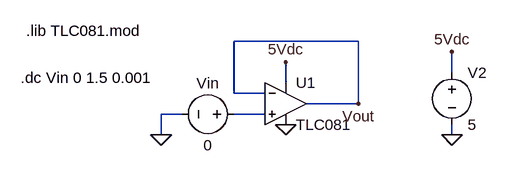
[diagram p0: schematic tlc082testing.asc]
tlc082testing.asc, the LTspice schematic file:
Version 4.1
SHEET 1 880 680
WIRE 304 80 112 80
WIRE 448 128 448 96
WIRE 192 144 192 112
WIRE 112 160 112 80
WIRE 160 160 112 160
WIRE 304 176 304 80
WIRE 304 176 224 176
WIRE 32 192 0 192
WIRE 160 192 112 192
WIRE 0 224 0 192
WIRE 448 224 448 208
FLAG 192 208 0
FLAG 192 112 5Vdc
FLAG 448 224 0
FLAG 448 96 5Vdc
FLAG 0 224 0
FLAG 304 176 Vout
SYMBOL OpAmps\\opamp2 192 112 R0
SYMATTR InstName U1
SYMATTR Value TLC081
SYMBOL voltage 128 192 R90
WINDOW 0 -32 56 VBottom 2
WINDOW 3 32 56 VTop 2
SYMATTR InstName Vin
SYMATTR Value 0
SYMBOL voltage 448 112 R0
WINDOW 123 0 0 Left 0
WINDOW 39 0 0 Left 0
SYMATTR InstName V2
SYMATTR Value 5
TEXT -208 64 Left 2 !.lib TLC081.mod
TEXT -216 136 Left 2 !.dc Vin 0 1.5 0.001

The netlist it stands for:
* tlc082testing.asc
X§U1 N001 Vout 5Vdc 0 Vout TLC081  ; pins In+ In- V+ V- OUT
Vin N001 0 0
V2 5Vdc 0 5
.lib TLC081.mod
.dc Vin 0 1.5 0.001
.backanno
.end